# Altium schematic sheet Power.SchDoc
size B; SheetNumber: 2; SheetTotal: 3
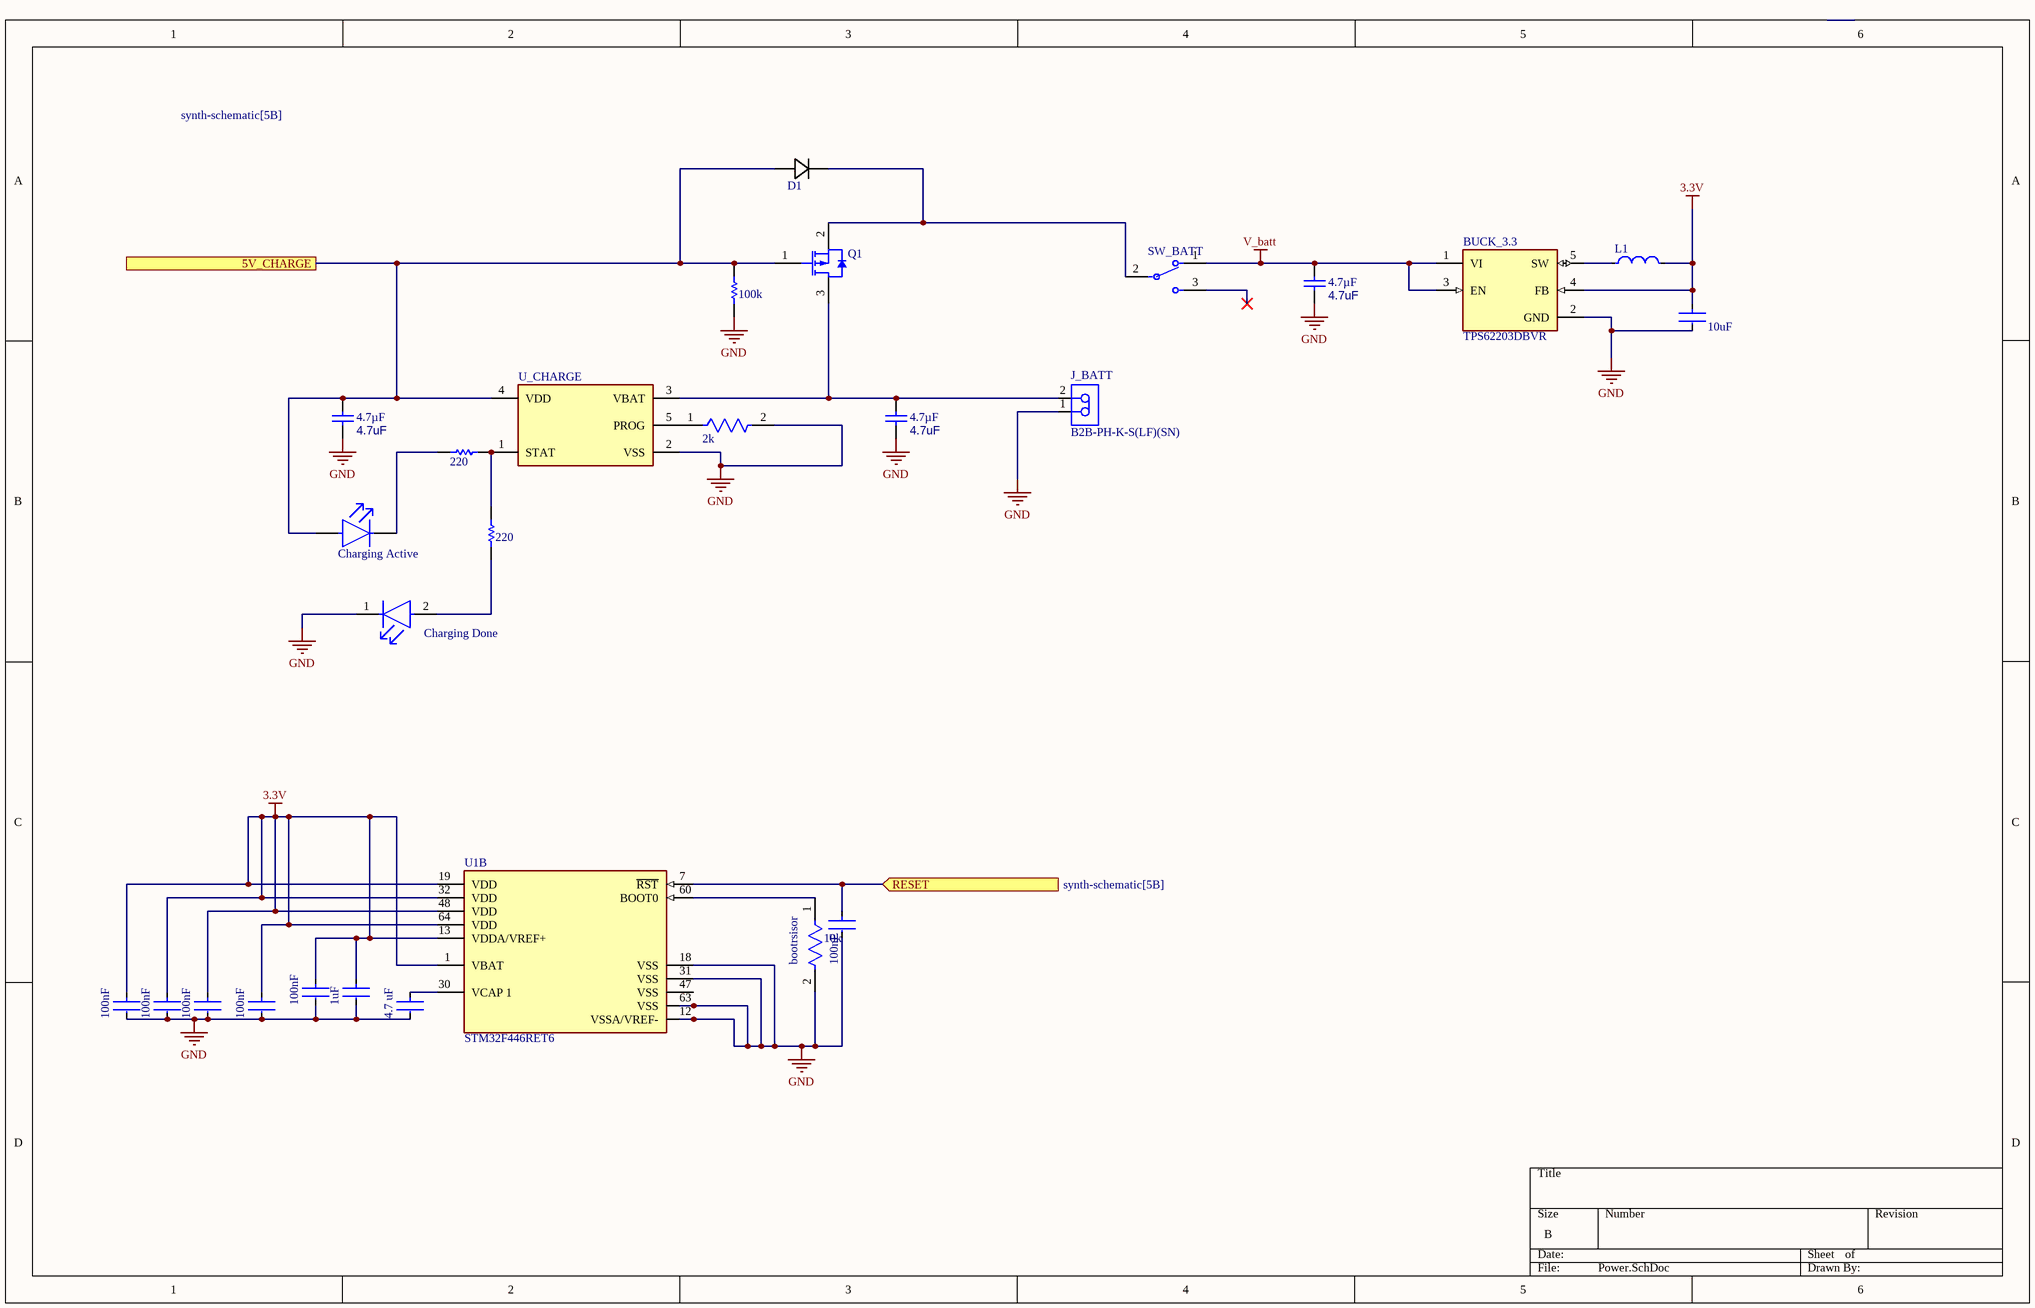
[diagram p0: Power.SchDoc]

## Parts
bootrsisor  10k  [FP-RT0603-MFG]
BUCK_3.3  TPS62203DBVR  [FP-DBV0005A-IPC_B]
C_BUCK  10uF  [FP-CC0603-DC-MFG]
C_CAP  4.7 uF  [FP-CC0603-DA-MFG]
C_PD_1  100nF  [FP-C0603C-CF-MFG]
C_PD_2  100nF  [FP-C0603C-CF-MFG]
C_PD_3  100nF  [FP-C0603C-CF-MFG]
C_PD_4  100nF  [FP-C0603C-CF-MFG]
C_PD_?  100nF  [FP-C0603C-CF-MFG]
C_Reset  100nF  [FP-C0603C-CF-MFG]
C_VDD  4.7uF  value 4.7µF  [CAPC0603(1608)100_L]
C_VDD2  4.7uF  value 4.7µF  [CAPC0603(1608)100_L]
C_VDD?  4.7uF  value 4.7µF  [CAPC0603(1608)100_L]
C_VDD_2  1uF  [FP-C0603-CJ-MFG]
Charging_Done  APHD1608LZGCK  [FP-APHD1608LZGCK-MFG]  (value not drawn)
D1  PMEG40T10ERX  [CR_SOD123W_NEX]  (value not drawn)
J_BATT  B2B-PH-K-S(LF)(SN)  [JST-B2B-PH-K-S_V]
L1  MLZ1608N100LT000  [FP-MLZ1608-IPC_A]  (value not drawn)
Q1  AO3401A  [AO-SOT-23-3L_V]  (value not drawn)
R_LED_1  220  [RESC1608X55X25NL10T15]
R_LED_2  220  [RESC1608X55X25NL10T15]
R_PROG  2k  [FP-AC0603-IPC_A]
R_PU  100k  [RESC0603(1608)_N]
STATUS_LED?  Charging Active  [FP-LTST-C190KRKT-MFG]
SW_BATT  JS102011SAQN  [FP-JS102011SAQN-MFG]  (value not drawn)
U1  STM32F446RET6  [FP-LQFP64-5W-MFG]  (part B of 2)
U_CHARGE  MCP73831T-2ATI/OT  [FP-C04-091-OT-IPC_C]  (value not drawn)

## Ports
5V_CHARGE (see synth-schematic[5B]), RESET (in, see synth-schematic[5B])

## Nets
3.3V: BUCK_3.3.4(FB) C_BUCK.1 C_PD_1.1 C_PD_2.1 C_PD_3.1 C_PD_4.1 C_PD_?.1 C_VDD_2.2 L1.2 U1.1(VBAT) U1.13(VDDA/VREF+) U1.19(VDD) U1.32(VDD) U1.48(VDD) U1.64(VDD)
GND: bootrsisor.2 BUCK_3.3.2(GND) C_BUCK.2 C_CAP.2 C_PD_1.2 C_PD_2.2 C_PD_3.2 C_PD_4.2 C_PD_?.2 C_Reset.2 C_VDD.1 C_VDD2.1 C_VDD?.1 C_VDD_2.1 Charging_Done.1(C) J_BATT.1 R_PROG.2 R_PU.2 U1.12(VSSA/VREF-) U1.18(VSS) U1.31(VSS) U1.63(VSS) U_CHARGE.2(VSS)
V_batt: BUCK_3.3.1(VI) BUCK_3.3.3(EN) C_VDD2.2 SW_BATT.1
5V_CHARGE: C_VDD.2 D1.2(ANODE) Q1.1(GATE) R_PU.1 STATUS_LED?.2(A) U_CHARGE.4(VDD) ; port 5V_CHARGE
RESET: C_Reset.1 U1.7(~{RST}) ; port RESET
Netbootrsisor_1: bootrsisor.1 U1.60(BOOT0)
NetBUCK_3.3_5: BUCK_3.3.5(SW) L1.1
NetC_CAP_1: C_CAP.1 U1.30(VCAP_1)
NetC_VDD?_2: C_VDD?.2 J_BATT.2 Q1.3(DRAIN) U_CHARGE.3(VBAT)
NetCharging_Done_2: Charging_Done.2(A) R_LED_2.1
NetD1_1: D1.1(CATHODE) Q1.2(SOURCE) SW_BATT.2(C)
NetR_LED_1_1: R_LED_1.1 STATUS_LED?.1(C)
NetR_LED_1_2: R_LED_1.2 R_LED_2.2 U_CHARGE.1(STAT)
NetR_PROG_1: R_PROG.1 U_CHARGE.5(PROG)

Not connected (* = marked no-connect by the designer): SW_BATT 3*; U1 47(VSS)

## Library data of the parts
bootrsisor = CMP-03412-024743-1: RES SMD 10K OHM 0.05% 1/10W 0603; Manufacturer: Yageo; Manufacturer Part Number: RT0603WRE0710KL; Power Rating: 0.1W; Value: 10KΩ; Voltage Rating: 75V; Tolerance: 0.0005; Temperature Coefficient: 50 ppm/°C; Height: 0.55mm; ComponentLink2URL: http://www.yageo.com/documents/recent/PYu-RT_1-to-0.01_RoHS_L_9.pdf; Mouser Description: Res SMD 10K Ohm 0.05% 1/10W 0603; Device Class L1: Passive Components; Octopart: https://octopart.com/rt0603wre0710kl-yageo-71396825; Lead Free: Yes; RoHS: TRUE; ComponentLink2Description: Datasheet; Package: RT0603; Ipc Land Pattern Name: RESC16080X45; Automotive: No; Temperature: -55°C to +155°C; Series: RT; Resistance: 10KΩ; Footprint Url: http://www.yageo.com/exep/pages/download/literatures/PYu-R_Mount_10.pdf; Temperature Range Low: -55°C; Digikey Description: RES SMD 10K OHM 0.05% 1/10W 0603; Category: Res; Device Class L3: Chip SMD Resistors; Temperature Range High: +155°C; Device Class L2: Resistors; Composition: Thin Film
BUCK_3.3 = CMP-04918-000656-1: IC REG BUCK 3.3V 300MA SOT23-5; Number of Outputs: 1; Nominal Supply Current: 15uA; Operating Supply Voltage: 6V; Min Input Voltage: 2.5V; Efficiency: 95%; Synchronous Rectifier: Yes; Output Type: Fixed; Switching Frequency: 1MHz; Output Configuration: Positive; Number of Pins: 5; Max Operating Temperature: 85°C; Output Voltage: 3.3V; Lead Free: Lead Free; Package Quantity: 3000; Output Current: 300mA; Min Output Voltage: 3.3V; Min Operating Temperature: -40°C; Packaging: Tape and Reel; Max Output Current: 300mA; Min Supply Voltage: 2.5V; RoHS Compliant: Yes; Supply Current: 15uA; Radiation Hardening: No; Quiescent Current: 15uA; Series: -; Contact Plating: Gold; Mount: Surface Mount; Case/Package: SOT-23-5; Max Input Voltage: 6V
C_BUCK = CMP-00621-81932632-1: CC0603KRX5R7BB106 Multilayer Ceramic Capacitor, 10 uF, 16 V, ± 10%, X5R, 0603 [1608 Metric]; Capacitance: 10µF; Voltage Rating: 16V; NexarPartId: 81932632; Height: 1mm; Halogen Free: Halogen Free; Dielectric: X5R; Max Operating Temperature: 85°C; Voltage Rating (DC): 16V; Material: Ceramic; Lead Free: Lead Free; Tolerance: 10%; RoHS: Non-Compliant; Min Operating Temperature: -55°C; Case/Package: 0603
C_CAP = CMP-03422-001204-1: CAP CER 4.7UF 25V X5R 0603; Manufacturer: YAGEO; Manufacturer Part Number: CC0603MRX5R8BB475; Temperature Coefficient: 15%; Tolerance: 0.2; Category: Cap; Package: CC0603-DA; Capacitance: 4.7 uF; Temperature: -55°C to +125°C; ComponentLink2Description: Datasheet; Octopart: https://octopart.com/cc0603mrx5r8bb475-yageo-81932637; Value: 4.7 uF; Voltage Rating: 25 V; Automotive: No; Device Class L2: Capacitors; Temperature Characteristic: X5R; Height: 0.9mm; Device Class L3: Ceramic Capacitors; Lead Free: Yes; Voltage: 25 V; Footprint Url: http://www.yageo.com/exep/pages/download/literatures/UPY-C_GEN_24.pdf; ComponentLink2URL: http://www.yageo.com/documents/recent/UPY-GPHC_X7R_6.3V-to-50V_18.pdf; Digikey Description: CAP CER 4.7UF 25V X5R 0603; Temperature Range Low: -55°C; Device Class L1: Passive Components; RoHS: TRUE; Material: Ceramic; Temperature Range High: +125°C
C_PD_1-C_PD_4 C_PD_? C_Reset = CMP-03020-027569-2: C0603 0.10 μF Y5V 30ppm/°C 20.00% 25 V; Manufacturer: KEMET; Manufacturer Part Number: C0603C104M3VAC7411; Value: 0.10 μF; Voltage Rating: 25 V; Automotive Grade: Grade 1; Tolerance: 0.2; ComponentLink2URL: https://api.kemet.com/component-edge/download/datasheet/C0603C100J5GACAUTO.pdf; Package: C0603C-CF; Lead Free: Yes; Device Class L1: Passive Components; Temperature Range High: +125°C; Material: Ceramic; ComponentLink2Description: Datasheet; Automotive: Yes; Temperature: -55°C to +125°C; Temperature Characteristic: Y5V; Capacitance: 0.10 μF; Octopart: https://octopart.com/c0603c104m3vac7411-kemet-2224281; Height: 0.87mm; RoHS: TRUE; Temperature Range Low: -55°C; Device Class L3: Ceramic Capacitors; Temperature Coefficient: 30ppm/°C; Category: Cap; Device Class L2: Capacitors
C_VDD C_VDD2 C_VDD? = CMP-001-00076-4: Chip Capacitor, 4.7µF +/-20%, 10V, 0603, Thickness 1 mm; Tolerance: 10%; Mounting Technology: SMT; Case/Package: 0603; Pins: 2; Min Operating Temperature: -55°C; Max Operating Temperature: 85°C; Voltage Rating: 10V
C_VDD_2 = CMP-03020-024138-1: CAP CER 0603 1UF 10V X7R 10%; Manufacturer: KEMET; Manufacturer Part Number: C0603C105K8RACAUTO; Temperature Coefficient: 15%; Automotive Grade: Grade 1; Device Class L3: Ceramic Capacitors; Octopart: https://octopart.com/c0603c105k8racauto-kemet-91328492; Capacitance: 1uF; Voltage Rating: 10V; Device Class L2: Capacitors; Lead Free: Yes; Device Class L1: Passive Components; ComponentLink2URL: https://content.kemet.com/datasheets/KEM_C1023_X7R_AUTO_SMD.pdf; Temperature Characteristic: X7R; Temperature Range Low: -55°C; Temperature Range High: +125°C; Material: Ceramic; Category: Cap; Ipc Land Pattern Name: CAPC16080X80; Tolerance: 10%; Package: C0603-CJ; ComponentLink2Description: Datasheet; Temperature: -55°C to +125°C; RoHS: TRUE; Value: 1uF; Height: 0.95mm; Automotive: Yes; Digikey Description: CAP CER 0603 1UF 10V X7R 10%
Charging_Done = CMP-44529-000045-1: LED GREEN CLEAR 1608 SMD; Test Current: 2mA; Dominant Wavelength: 525nm; Lens Color: Colorless; Luminous Intensity: 180mcd; Viewing Angle: 100°; Forward Voltage: 2.65V; Lens Size: 0.7mm; Lens Style: Round; Mount: Surface Mount; Packaging: Tape and Reel; Lens Transparency: Clear; Height: 0.75mm; Case/Package: 0603; Length: 1.6mm; Case Code (Metric): 1608; Width: 0.8mm; Color: Green; Case Code (Imperial): 0603
D1 = PMEG40T10ERX: Description; Manufacturer_Name: Nexperia; Type: Diodes - Rectifiers, Single; Copyright: Copyright (C) 2025 Ultra Librarian. All rights reserved.; Manufacturer_Part_Number: PMEG40T10ERX
J_BATT = CMP-2000-05162-1: Male Header, Pitch 2 mm, 1 x 2 Position, Height 6 mm, Tail Length 3.4 mm, -25 to 85 degC, RoHS, Bulk; Manufacturer: JST; Pitch: 2mm; Style/Orientation: StraightHeader/Plug; No of Positions: 2; Datasheet Version: Nov-08; Datasheet URL: http://datasheet.octopart.com/B2B-PH-K-S%28LF%29%28SN%29-JST-datasheet-8324864.pdf; Manufacturer URL: http://www.jst.com/home2.html; Type: ShroudedHeader; Termination: Crimp
L1 = CMP-08253-000255-1: Shielded Multilayer Inductor 10uH ±20% 300mA 780mΩ SMD 0603; Self Resonant Frequency: 50MHz; Core Material: Ferrite; Saturation Current: 60mA; Test Frequency: 2MHz; DC Resistance (DCR): 780mR; Lead Free: Lead Free; Case Code (Metric): 1608; Min Operating Temperature: -55°C; Length: 0.063inch; Max Operating Temperature: 125°C; RoHS Compliant: Yes; Case/Package: 0603; Mount: Surface Mount; Tolerance: 20%; Packaging: Tape and Reel; Height - Seated (Max): 0.037inch; Shielding: Shielded; Case Code (Imperial): 0603; Current Rating: 300mA; Package Quantity: 4000; Width: 0.031inch; Inductance: 10uH
Q1 = CMP-2000-05778-1: P-Channel MOSFET, 30 V, 4 A, -55 to 150 degC, 3-Pin SOT-23-3L, RoHS, Tape and Reel; Manufacturer: Alpha and Omega; Output Power (Max): NotRequiredW; Power Dissipation: 1.4W; Rad Hardened: No; Drain Efficiency: NotRequired%; Drain-Source On-Volt: 30V; Noise Figure: NotRequireddB; Frequency (Max): NotRequiredMHz; Number of  Elements: 1; Gate-Source Voltage (Max): ?12V; Drain Current (Max): 4A; Channel Mode: Enhancement; Drain-Source On-Res: 0.044ohm; Type: PowerMOSFET; Polarity: P; Package URL: http://www.aosmd.com/res/packaging_information/SOT-23-3L.pdf; Datasheet URL: http://www.aosmd.com/res/data_sheets/AO3401A.pdf; Package Type: SOT-23; Package Description: 3-Pin Small Outline Transistor, Body 2.95 x 1.6 mm, Pitch 0.95 mm; Mounting: SurfaceMount; Manufacturer URL: http://www.aosmd.com/; Continuous Drain Current: 4A; Package Reference: SOT-23-3L; Mounting Technology: SurfaceMount; Operating Temperature Classification: Military; Power Gain: NotRequireddB; Datasheet Version: Rev. 3, 03/2011; Operating Temp Range: -55Cto150C; Pin Count: 3
R_LED_1 R_LED_2 = CMP-2000-04322-1: Part Number: RC0603JR-13220RL; Manufacturer: Yageo
R_PROG = CMP-03412-038916-1: RES 2kΩ 1.00% 0.2W 0603
R_PU = CMP-1012-00736-1: 100K 0.1W 1% 0603 (1608 Metric)  SMD; Value: 100000.00 Ohm; Case-Metric: 1608; Case-EIA: 0603; Power: 0.1 W; Tolerance: 1 %; Technology: SMT
STATUS_LED? = CMP-1674-00011-2: LED RED CLEAR CHIP SMD; Reverse Voltage: 5V; Viewing Angle: 130°; Power Rating: 75mW; Test Current: 20mA; Number of Elements: 1; Lens Color: Colorless; Wavelength: 639nm; Dominant Wavelength: 631nm; Lens Style: Diffused; Forward Current: 30mA; Forward Voltage: 2.4V; Luminous Intensity: 54mcd; Color: Red; Case Code (Imperial): 0603; Lens Transparency: Clear; Lead Free: Lead Free; Package Quantity: 1; Packaging: Tape and Reel; Max Operating Temperature: 85°C; Number of Pins: 2; Height: 0.8mm; Case/Package: 0603; Number of LEDs: 1; Width: 0.8mm; Case Code (Metric): 1608; Depth: 0.8mm; Mount: Surface Mount; Radiation Hardening: No; Length: 1.6mm; Illumination Color: Red; Power Dissipation: 75mW; Min Operating Temperature: -55°C
SW_BATT = CMP-2000-06501-2: SWITCH SLIDE SPDT 300MA 6V; Switch Function: On-On; Illumination Type: Non-Illuminated; Switch Travel: 2mm; Contact Resistance: 70mR; Actuator Material: Nylon; Electrical Life: 5000Cycles; Actuator Type: Standard; Max Operating Temperature: 85°C; Housing Material: Nylon; Radiation Hardening: No; Max Voltage Rating (DC): 6V; Package Quantity: 1; Case/Package: 100; Actuator Length: 2mm; Min Operating Temperature: -40°C; Contact Current Rating: 300mA; REACH SVHC: No SVHC; Throw Configuration: SPDT; Packaging: Tape and Reel; Contact Material: Copper Alloy; Max Current Rating: 300mA; Current Rating: 300mA; Mount: Surface Mount; Lead Free: Lead Free; Termination: Gull Wing; Voltage Rating (DC): 6V; Length: 9mm; Orientation: Right Angle; Contact Plating: Silver
U1 = CMP-12105-000007-1: IC MCU 32BIT 512KB FLASH 64LQFP; Manufacturer: ST; Number Of Spi Channels: 4; Ram Size: 128KBytes; Standoff Height: 0.05mm; Number Of Uart Channels: 6; Number Of Pwm Channels: 32; Max Junction Temp: +105°C; Number Of I/Os: 50; Number Of Usb Channels: 2; Frequency: 180MHz; Number Of A/D Converters: 3; Max Supply Voltage: 3.6V; Number Of Adc Channels: 16; Interface: I2C,SPI,UART,USART,CAN,USB,LIN,IrDA,I2S,Other; Memory Size: 512KBytes; Number Of Timers/Counters: 14; Min Supply Voltage: 1.7V; Core Architecture: ARM Cortex-M4; Data Bus Width: 32bits; Number Of Cores: 1; Ambient Temperature Range Low: -40°C; ComponentLink2URL: https://www.st.com/en/microcontrollers-microprocessors/stm32f446re.html; Category: IC; Height: 1.6mm; Ipc Land Pattern Name: QFP50P1200X1200X160-64; Manufacturer Part Number: STM32F446RET6; Octopart: https://octopart.com/stm32f446ret6-stmicroelectronics-52642920; Temperature Range High: +105°C; Lead Free: Yes; Mouser Description: ARM Microcontrollers - MCU High-performance and DSP with FP, ARM Cortex-M4 MCU with 512 Kbytes Flash, 180 MHz CPU, Art Accelerator, SDRAM; Digikey Description: IC MCU 32BIT 512KB FLASH 64LQFP; Ambient Temperature Range High: +85°C; Number Of I2C Channels: 4; Memory Type: FLASH; RoHS: TRUE; Automotive: No; Device Class L1: Integrated Circuits (ICs); Temperature: -40°C to +105°C; Device Class L2: Embedded Processors and Controllers; Device Class L3: Microcontrollers; Temperature Range Low: -40°C; Package: LQFP64-5W; ComponentLink2Description: Datasheet
U_CHARGE = CMP-0133-00144-2: IC CONTROLLR LI-ION 4.2V SOT23-5; Max Supply Voltage: 6V; Max Output Current: 500mA; Min Output Voltage: 4.168V; Max Output Voltage: 4.232V; Min Supply Voltage: 3.75V; Number of Cells: 1; Lead Free: Lead Free; Number of Pins: 5; Package Quantity: 3000; Min Operating Temperature: -40°C; Width: 1.8mm; Max Charge Current: 500mA; Output Current: 500mA; Packaging: Tape and Reel; Height: 1.3mm; Output Voltage: 4.2V; Max Operating Temperature: 85°C; Mount: Surface Mount; Case/Package: SOT-23; Length: 3.1mm; REACH SVHC: No SVHC